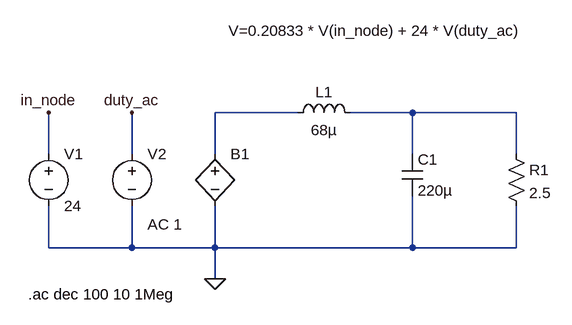
[diagram p0: schematic SIM-ANALOG-003.asc]
SIM-ANALOG-003.asc, the LTspice schematic file:
Version 4.1
SHEET 1 880 680
WIRE 256 16 128 16
WIRE 432 16 336 16
WIRE 592 16 432 16
WIRE -128 80 -128 16
WIRE 0 80 0 16
WIRE 128 80 128 16
WIRE 432 80 432 16
WIRE 592 80 592 16
WIRE -128 224 -128 160
WIRE 0 224 0 160
WIRE 0 224 -128 224
WIRE 128 224 128 160
WIRE 128 224 0 224
WIRE 432 224 432 144
WIRE 432 224 128 224
WIRE 592 224 592 160
WIRE 592 224 432 224
WIRE 128 272 128 224
FLAG 128 272 0
FLAG -128 16 in_node
FLAG 0 16 duty_ac
SYMBOL bv 128 64 R0
WINDOW 3 474 -174 Right 2
SYMATTR InstName B1
SYMATTR Value V=0.20833 * V(in_node) + 24 * V(duty_ac)
SYMBOL ind 240 32 R270
WINDOW 0 32 56 VTop 2
WINDOW 3 5 56 VBottom 2
SYMATTR InstName L1
SYMATTR Value 68µ
SYMATTR SpiceLine Rser=25m
SYMBOL cap 416 80 R0
SYMATTR InstName C1
SYMATTR Value 220µ
SYMATTR SpiceLine Rser=25m
SYMBOL res 576 64 R0
SYMATTR InstName R1
SYMATTR Value 2.5
SYMBOL voltage -128 64 R0
WINDOW 123 0 0 Left 0
WINDOW 39 0 0 Left 0
SYMATTR InstName V1
SYMATTR Value 24
SYMBOL voltage 0 64 R0
WINDOW 123 24 124 Left 2
WINDOW 39 0 0 Left 0
SYMATTR InstName V2
SYMATTR Value ""
SYMATTR Value2 AC 1
TEXT -160 296 Left 2 !.ac dec 100 10 1Meg

The netlist it stands for:
* SIM-ANALOG-003.asc
B1 N001 0 V=0.20833 * V(in_node) + 24 * V(duty_ac)
L1 N001 N002 68µ Rser=25m
C1 N002 0 220µ Rser=25m
R1 N002 0 2.5
V1 in_node 0 24
V2 duty_ac 0 AC 1
.ac dec 100 10 1Meg
.backanno
.end